# Altium schematic sheet Seven-Seg.SchDoc
size B; SheetNumber: 1; SheetTotal: 4
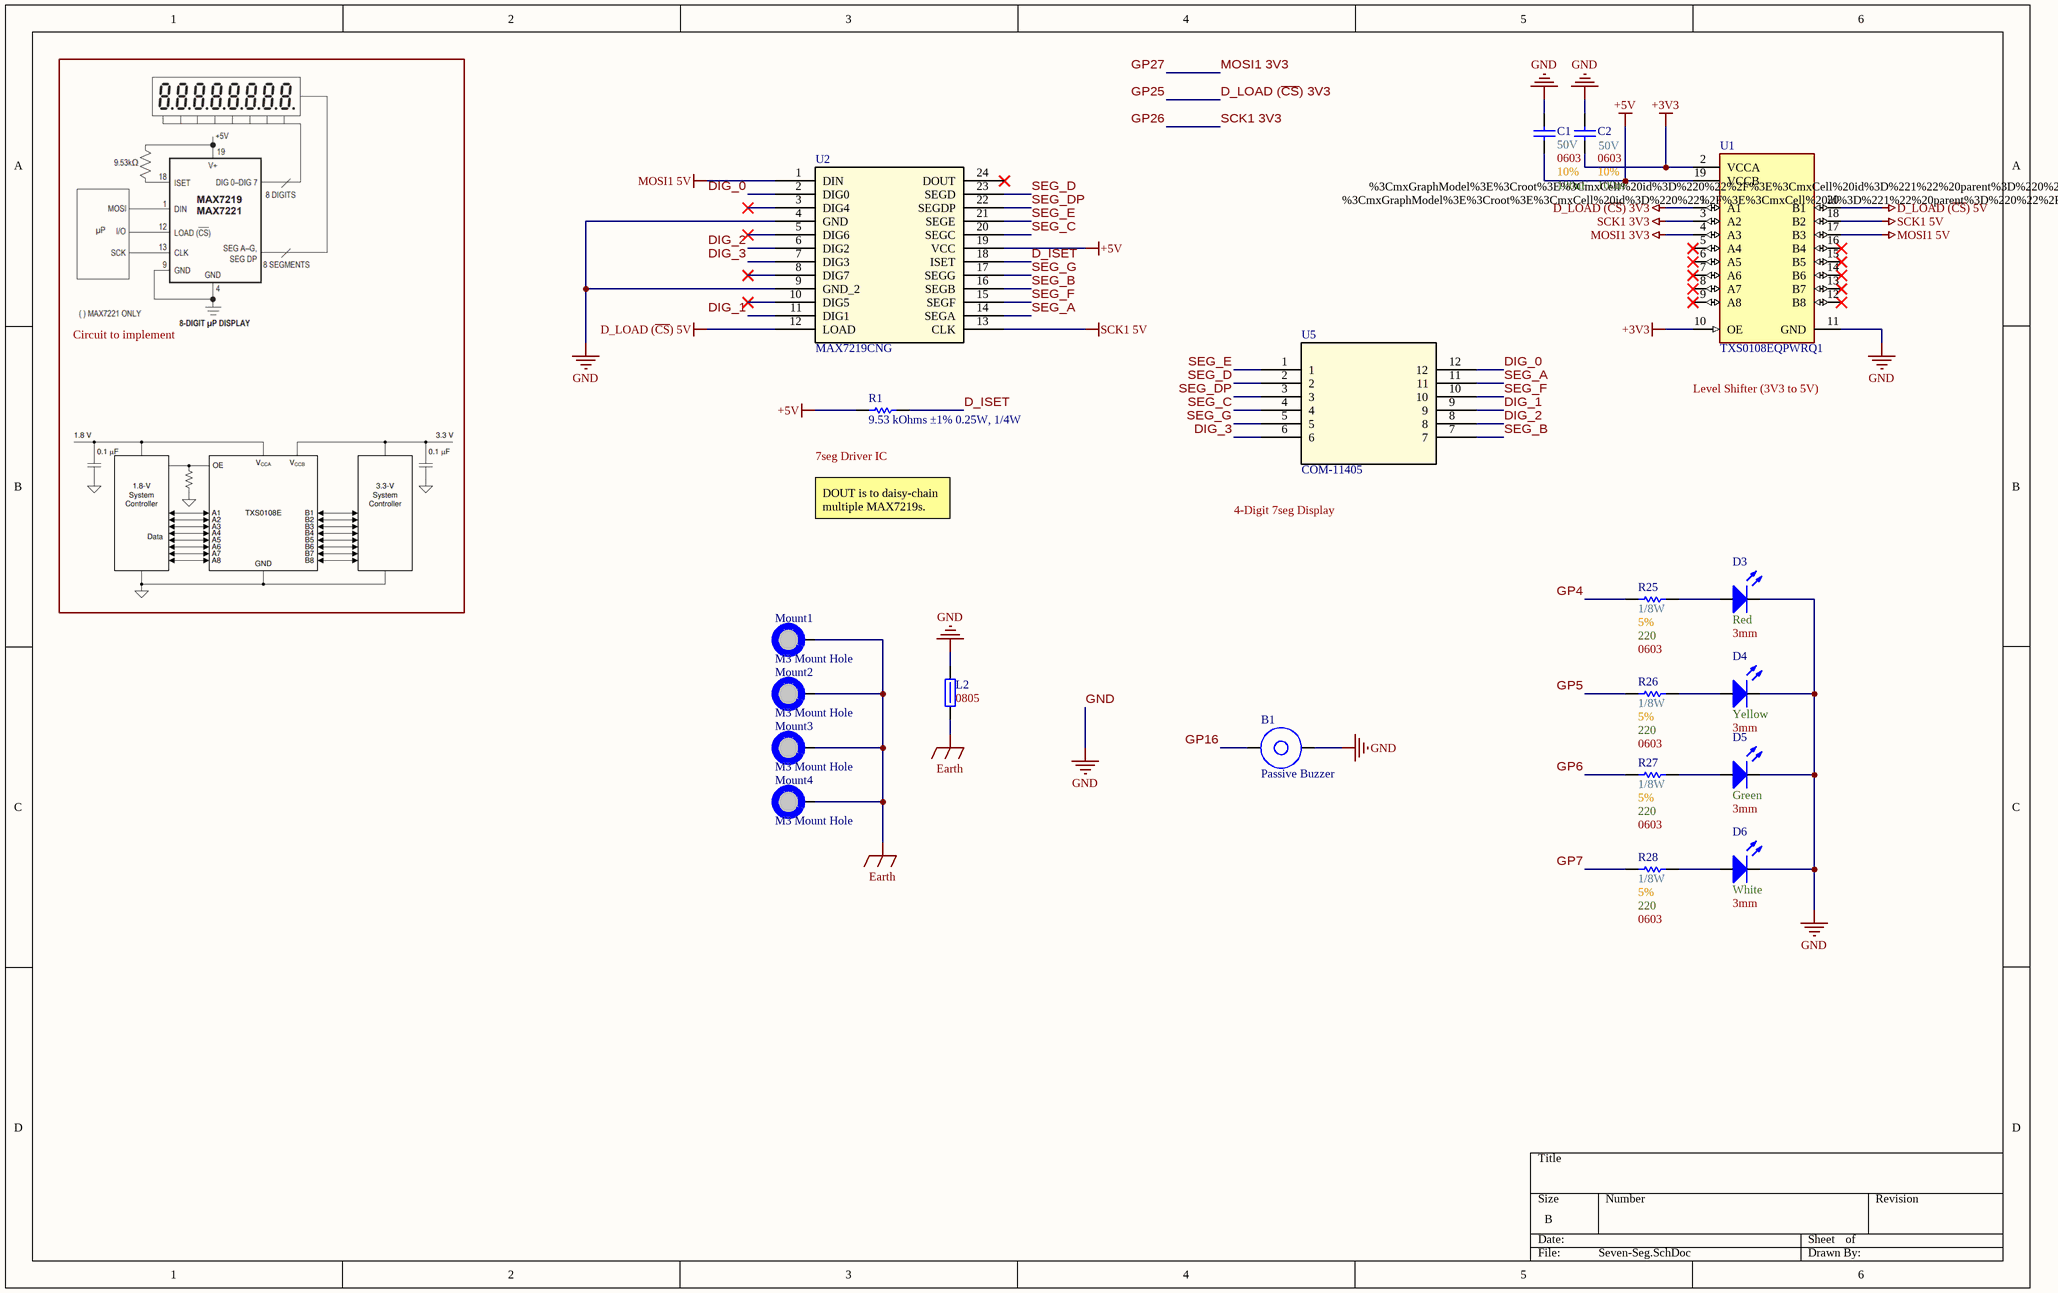
[diagram p0: Seven-Seg.SchDoc]

## Parts
B1  Passive Buzzer  [[Buzzer] Passive Thru-Hole 3V 30mA]
C1  Max Voltage: 50V  Size Package: 0603  Tolerance: 10%  Capacitance: 100nF  [[Cap] SMD 0603]  (hidden comment: [Cap] 0603 0.1uF 10% 50V)
C2  Max Voltage: 50V  Size Package: 0603  Tolerance: 10%  Capacitance: 100nF  [[Cap] SMD 0603]  (hidden comment: [Cap] 0603 0.1uF 10% 50V)
D3  Color: Red  Lens Diameter: 3mm  [[LED] Thru-Hole 3mm Red]  (hidden comment: [LED] Thru-Hole 3mm Red)
D4  Color: Yellow  Lens Diameter: 3mm  [[LED] Thru-Hole 3mm Yellow]  (hidden comment: [LED] Thru-Hole 3mm Yellow)
D5  Color: Green  Lens Diameter: 3mm  [[LED] Thru-Hole 3mm Green]  (hidden comment: [LED] Thru-Hole 3mm Green)
D6  Color: White  Lens Diameter: 3mm  [[LED] Thru-Hole 3mm White]  (hidden comment: [LED] Thru-Hole 3mm White)
L2  Size Package: 0805  [[Ferrite] SMD 0805]  (hidden comment: 652-MH2029-300Y)
Mount1  M3 Mount Hole  [[Mount] M3 Mount Hole]  (no BOM)
Mount2  M3 Mount Hole  [[Mount] M3 Mount Hole]  (no BOM)
Mount3  M3 Mount Hole  [[Mount] M3 Mount Hole]  (no BOM)
Mount4  M3 Mount Hole  [[Mount] M3 Mount Hole]  (no BOM)
R1  9.53 kOhms ±1% 0.25W, 1/4W  [RESC2013X60X30LL20T20]
R25  Wattage: 1/8W  Tolerance: 5%  Resistance: 220  Size Package: 0603  [[Res] SMD 0603]  (hidden comment: [220] SMD 0603 5% 1/10W)
R26  Wattage: 1/8W  Tolerance: 5%  Resistance: 220  Size Package: 0603  [[Res] SMD 0603]  (hidden comment: [220] SMD 0603 5% 1/10W)
R27  Wattage: 1/8W  Tolerance: 5%  Resistance: 220  Size Package: 0603  [[Res] SMD 0603]  (hidden comment: [220] SMD 0603 5% 1/10W)
R28  Wattage: 1/8W  Tolerance: 5%  Resistance: 220  Size Package: 0603  [[Res] SMD 0603]  (hidden comment: [220] SMD 0603 5% 1/10W)
U1  TXS0108EQPWRQ1  [FP-PW0020A-MFG]
U2  MAX7219CNG  [21-0043D_24_MXM]
U5  COM-11405  [COM-11405_SPK]

## Nets
+3V3: C2.1 U1.2(VCCA) U1.10(OE)
+5V: C1.1 R1.1 U1.19(VCCB) U2.19(VCC)
D_LOAD (~{CS}) 3V3: U1.1(A1)  [also labelled GP25]
D_LOAD (~{CS}) 5V: U1.20(B1) U2.12(LOAD)
Earth: L2.2 Mount1.1 Mount2.1 Mount3.1 Mount4.1
GND: B1.2(-) C1.2 C2.2 D3.2(Cathode) D4.2(Cathode) D5.2(Cathode) D6.2(Cathode) L2.1 U1.11(GND) U2.4(GND) U2.9(GND_2)
GP26: U1.3(A2)  [also labelled SCK1 3V3]
GP27: U1.4(A3)  [also labelled MOSI1 3V3]
MOSI1 5V: U1.17(B3) U2.1(DIN)
SCK1 5V: U1.18(B2) U2.13(CLK)
D_ISET: R1.2 U2.18(ISET)
DIG_0: U2.2(DIG0) U5.12
DIG_1: U2.11(DIG1) U5.9
DIG_2: U2.6(DIG2) U5.8
DIG_3: U2.7(DIG3) U5.6
GP4: R25.1
GP5: R26.1
GP6: R27.1
GP7: R28.1
GP16: B1.1(+)
SEG_A: U2.14(SEGA) U5.11
SEG_B: U2.16(SEGB) U5.7
SEG_C: U2.20(SEGC) U5.4
SEG_D: U2.23(SEGD) U5.2
SEG_DP: U2.22(SEGDP) U5.3
SEG_E: U2.21(SEGE) U5.1
SEG_F: U2.15(SEGF) U5.10
SEG_G: U2.17(SEGG) U5.5
NetD3_1: D3.1(Anode) R25.2
NetD4_1: D4.1(Anode) R26.2
NetD5_1: D5.1(Anode) R27.2
NetD6_1: D6.1(Anode) R28.2

Not connected (* = marked no-connect by the designer): U1 5(A4)* 6(A5)* 7(A6)* 8(A7)* 9(A8)* 12(B8)* 13(B7)* 14(B6)* 15(B5)* 16(B4)*; U2 3(DIG4)* 5(DIG6)* 8(DIG7)* 10(DIG5)* 24(DOUT)*

## Notes on the sheet
- %3CmxGraphModel%3E%3Croot%3E%3CmxCell%20id%3D%220%22%2F%3E%3CmxCell%20id%3D%221%22%20parent%3D%220%22%2F%3E%3CmxCell%20id%3D%222%22%20parent%3D%221%22%20style%3D%22shape%3Dimage%3BverticalLabelPosition%3Dbottom%3BlabelBackgroundColor%3Ddefault%3BverticalAlign%3Dtop%3Baspect%3Dfixed%3BimageAspect%3D0%3Bimage%3Ddata%3Aimage%2Fpng%2CiVBORw0KGgoAAAANSUhEUgAAAL4AAADECAYAAAAhzZs6AAAAAXNSR0IArs4c6QAAAARnQU1BAACxjwv8YQUAAAAJcEhZcwAAEnQAABJ0Ad5mH3gAABu5SURBVHhe7d17WFT1vsfxjzMKhEPAcGdUrnJRA4EIEy%2Bp%2B1jtNgTm8QiashMlE3aJJngShK2BYiFna7azsq25rUzzqVQ6bjUuSSpIQjvTyUE4KVchLiK3mfmePwaRWQmSghrr%2B3qeeXqe9Vuz1tB6z%2FSbH9oaQkSEQaSwsBCRkZEoLCwUDg0agYGBSEtLQ2BgoHCI9ZFEuIExMeDwmShx%2BEyUOHwmShw%2BEyUOn4lSn8LXNpSiIPsYvj5dggaNcFRHW%2F09ck5fwjWtcIQ9CNrrlDh1%2FCiOn1SiVn1zu%2FZaJVRKJZRKJZRKFcoqG9BtGGitQamqovuWTu1oamoTbuykxbVKVecxlVCVVaC%2Bvdvw9RpcUl1CzfVu2wBcr74EVWktWvU3DwzqlZrKPnuJ%2FGzs6ZFpM2mKpw1Z%2BkbT51c0gt1U9M4fLWmoTQR90aI%2FdK%2BdOXOGfHx8hJsHlYkTJ9I333wj3NyDJsrPCKXRchtyD5hEEzztSO4aQptPNxERUfO%2BMDIfZkK2Do7k6OhACrmMzN2epoTMclITUVvuK%2BQmC%2Bk6WltVIe1%2FI5qCvRXkvfIEtXU7003NtC%2FMnIaZ2JKDoyM5KCzJxNSBnnh5P5Woiagpl1aMk5F7zFFq7HyGpi6TokbLyOe1b6lZcLSB0Hv4LV%2FREgd7Ct15mTRERK1FlOxvQr5JRdTRtZOaSt8PIQfZQyTl8O%2BJ3xK%2BWpVOU008aNnROt011DTSqQR%2FMhufQPltuvAt7BfRwRvXTV1LJ5Ink7ldOH1aq9EPv%2BUgRbqMoseei6bwR03JY0Vv4VuQ%2FaKDpDushpqKM%2BgpG0t6bvdV0pCG6v%2B1jNxNvGl1XjMRNVHOinFkMjaWsnTvxwHX%2B1RHLcfkpSlYFWynmxMZusHLwxhNtb%2FgxoxH8%2FNHWLmhGn9eH44RUv2ns%2FtPU1WOKq0d3NxMdddQYgK%2FqFSkzB0HA%2BHOACCVY2L085jQWIC8c3qTHsBgGjafLcGpfRsR6jpMf6xXEsjGPo9Zvtdx%2FnsV1JDAdHoyNs1pxNsrMlDw7SYsf68N899Yg8ky4XMHRu%2Fhy%2FwxP24hJpjpdtNWH8L%2BHBNMD%2FKDIQBoK7Av7q%2F4v7AMvDxmqPDZ7AFg4BuOBT5FSAqaj3W7c6Cq10CqmIGlcXPgdcvygevnzqMUlrC1FnySSYwhk93Zp5v68mEcKTaG2xhHDAUAiQWeeX0TnrmShqeCNqN21iYkzzS%2FTZD9p%2B%2FnUSvxQVQs8qakYu0MGQAtqg%2BsRsKFWUhf5Y%2BHhPuzB4OhD%2BIyc7E9RIIjiUHwHOGMKYu3IK%2Fm5iqEtiYbW5bHICYmGi9GBCFw1g5II%2BKxwPXOItfRouqLVzHzial4zNUMRk4xuPjHLUgLt%2B6KTmLzNF74kwXq623xbMSTsOp7jXetb6fSViMzdg6S6pZgz7bZsJMA2pqDWB2Xg0dj5sLqihIXy67ievNVlKlKUXNPvpazvpLIxmB20m7kllRAeWgNxhUnIyhsKy50rdAZQW6vgEIxEq5%2BoVj7ZTHytwbBtm919GioxyzErUnA2qgpsBo%2BDuHLZ8O128Sg%2Fd9vIWlPKzw9GrEz6W38KJhZDSjhpP%2FXrlH%2Bhmk00msZHay8uZrT8sXL5PfII%2FRI52PsSDOSSMxopFcwvVl086vvvcZfbrtT05Uv19FLb35N9d0W4tpyl5Pb8CfpnWrNr7%2FcCghXdXSa6dO5ln3%2Fcqsppw9n2ZIifC9V3Xgd6gu05Q8WZPvcLipTvUt%2FsrakJ7ddJLX%2BgQbMbd7Taqh2RiDsPWusP5CBZ2xu7m4UlIGC4mIUdz7OvP9fGGkbgrdOfY5YL57vPxikMDWqwJGURKTnVurW57UNKM4qQLW1C1wevs3l7y8SO8xdEwWbQ68jI78VgAaXdsRiXZE%2FktLCMcr5z3jjNW%2FkJ6%2FArrIeflHUz3r%2FyduOYeOaAyj9%2BTD%2B4mcFc3Nz3cNuPvYKfvnAHkzDp2%2FAxykuyAzzgM1IFzgrHDBzlxli31%2BLaYbCvQfOUO8Y%2FHfQVbyTvBOq0j1YufYExsSnY5GzFIAU7i9uxirXLCSs2ovye%2FBL0CHEfxHld%2BfO%2FiJKK%2BrKylCttYSjkwWMhMMi0%2FsnPhtEjCB3cIcHRw9w%2BEysOHwmShw%2BEyUOn4kSh89EicNnosThM1Hi8JkocfhMlDh8JkocPhMlDp%2BJEofPRInDZ6LE4TNR4vCZKHH4TJQ4fCZKHD4TJQ6fiRKHz0SJw2eixOEzUeLwmShx%2BEyUOHwmShw%2BEyUOn4kSh89EicNnosThM1Hi8JkocfhMlDh8JkocPhMlDp%2BJEofPRInDZ6LE4TNR4vCZKHH4TJQ4fCZKHD4TJQ6fiRKHz0SJw2eiNOTAgQMk3Ph7plKp8NZbbyE9PV04NGjEx8dj4cKF8PT0FA6xPhry7LPPDqrw6%2BvrcfbsWTzxxBPCoUEjJycHY8eOhYWFhXCI9dEQIhpU4RcWFiIyMhKFhYXCoUEjMDAQaWlpCAwMFA6xPuI5PhMlDp%2BJEofPRInDZ6LE4TNR4vCZKHH4TJQ4fCZKfQpf21CKguxj%2BPp0CRo03QeuoVKlhFJ583GxvAHabruwB0N7nRKnjh%2FF8ZNK1Kpvbtdeq4Sq6%2FqpUFbZgG7DQGsNSlUV3bd0akdTU5tw46%2B0VZ1D3rHjyPmuDE2%2FCqMddcpTOH70OE4qa%2FXPO9CoV2oq%2B%2Bwl8rOxp0emzaQpnjZk6RtNn1%2FR6IabPqQQmQE9ZGpGZma6h%2FXsnfSL8DD30JkzZ8jHx0e4eVCZOHEiffPNN8LNPWii%2FIxQGi23IfeASTTB047kriG0%2BXQTERE17wsj82EmZOvgSI6ODqSQy8jc7WlKyCwnNRG15b5CbrKQrqO1VRXS%2FjeiKdhbQd4rT1BbtzPp0VTQV2um00hzBT3y%2BETydZKTpc8S%2BkSl1o035VNG6GiS27hTwKQJ5GknJ9eQzdT5sgZc7%2BG3fEVLHOwpdOdl0hARtRZRsr8J%2BSYVUQcRqX%2FaSIEWs%2Bmja8In3j8cvj61Kp2mmnjQsqN1umuoaaRTCf5kNj6B8tt04VvYL6KDLTeeUEsnkieTuV04fVqr0Q%2B%2F5SBFuoyix56LpvBHTcljRU%2Fha6j8w%2BfIThFMb%2F%2FQeeCOMto9ZwRZBX9AVzRqUqVPJROPZXS0Tvchqmk8RQn%2BZjQ%2BIV%2F%2FUAOk96mOWo7JS1OwKthONycydIOXhzGaan%2BBBoCmogJXLexhN1T4RPag0FSVo0prBzc3U901lJjALyoVKXPHwUC4MwBI5ZgY%2FTwmNBYg75xg8mEwDZvPluDUvo0IdR2mP9ad9go%2B%2B8cRWEUk4oUxRrptQ0fhP1fG4g%2BG1Sjt0KCqvApaOze4meoSlJj4ISo1BXPHGUBzaReiglbhb1tfxAwvFziPfQJL%2FvEDWvXPcld6D1%2Fmj%2FlxCzHBTLebtvoQ9ueYYHqQHwwBqCsrUV2bieVedjC3csKjczYgq%2FpXEzl2Hxn4hmOBTxGSguZj3e4cqOo1kCpmYGncHHjdsnzg%2BrnzKIUlbK2l%2BgMSY8hkgm230vETzpUMhYeXp96by8B%2FOfbsXYWJhgbwDV8An6IkBM1fh905KtRrpFDMWIq4OV6g5lKc%2Bd%2B38N5Zf6z9%2BDA%2BjDTBoRVr8dkv%2FddW7%2BF3p1big6hY5E1JxdoZMt02p%2BlYMD8SSXvzUHD4dQRcTMX8V79AP74%2BdrcMfRCXmYvtIRIcSQyC5whnTFm8BXk1Ny%2BStiYbW5bHICYmGi9GBCFw1g5II%2BKxwLUPkd8KtaKt3QCGhj3nZegTh8zc7QiRHEFikCdGOE%2FB4i156HpZhlMRk7YIU8a4I%2FCFWfBtL8VPl%2FsvrJ5fWXfaamTGzkFS3RLs2TYbdp3PMn50MTIyViHY2wku%2FuHYuCYY2uxMFHQID8DuJ4lsDGYn7UZuSQWUh9ZgXHEygsK24kLXCp0R5PYKKBQj4eoXirVfFiN%2FaxBs%2B1bHrw0xhrFRG643d18CFJJANmY2knbnoqRCiUNrxqE4OQhhWy90jkshvfG%2BGyqFFFpo%2B6%2F7voTfjIJNcxGVPQl%2F37saAZ0f9kA7Lhx%2BHwfO3ly%2BHGZqAqOOdrQOqj%2Fh%2F3umQfnB9ViWnoUGLQAYw3HqYmS8uQCWJw8ju0535SRWAZj3ajzi4%2BOwMuYFhASMROfM%2FM4M84SXO%2FDvM9%2Bhvdvm1uOrMXnSanx9vRwH1y9DelZnO8aOmLo4A28usMTJw9ndnjFwbhO%2BGqqdEQh7zxrrD2TgGRv93Rvz%2FoYXX%2F0A59sAaGtw7JNjaPB%2BHL49zB3ZvSaFqVEFjqQkIj23UrdOrm1AcVYBqq1d4PLwbS7%2FnZJYIXRxMFp3JyI9vx5aANqmImzbsANlLgEYb2QKo4ojSElMR26l7gu0tqEYWQXVsHZxER5tQPT%2Bk7cdw8Y1B1D682H8xc8K5ubmuofdfOy9bgC%2FFVvx8tD%2FwVQnN3g6e%2BD5XD%2BkbloARe9HZffQ8Okb8HGKCzLDPGAz0gXOCgfM3GWG2PfXYpqhcO%2F%2BIoFF8P%2Fg43g5PnzKCSOcXaEY9QS2Gy%2FHP9ODYS4ZjukbPkaKSybCPGww0sUZCoeZ2GUWi%2FfXThMebGAI1zd%2FOw01V5XQhYtV9CAs5%2FM6fk9aqLb0PP1YcpVuLNnfEy3VVPLjOSqp7uGsLbVUev5HKrnaw%2FgA6YfPZgmMrZ3g5mKN4cIh9gAxgtzBHR5OFnc3f%2F%2BtjKzg5OEJJ6sezmokh4O7B5wsehgfIP0QPmO%2FPxw%2BEyUOn4kSh89EicNnosThM1Hi8JkocfhMlDh8JkocPhMlDp%2BJEofPRInDZ6LE4TNR4vCZKHH4TJQ4fCZKHD4TJQ6fiRKHz0SJw2eixOEzUeLwmShx%2BEyUOHwmShw%2BEyUOn4nSEKlUOqj%2Bb%2FZEBK1WC2nXXQUGH41GA4lEgiFDhgiHWB8N6ejoGFThFxYWIioqCvn5%2BcKhQWPKlClITU1FYGCgcIj10RAiGnThR0ZGorCwUDg0aAQGBiItLY3Dvws8x2eixOEzUeLwmShx%2BEyUOHwmShw%2BEyUOn4lSn8LXNpSiIPsYvj5dgoYe7tKubqrElZrmrrucswdLe50Sp44fxfGTStTq7qkMANBeq4RKqYRSqYRSqUJZZYPuRtA3tNagVFXRfUundjQ1tQk36muvg%2FLUcRw9fhLK7ift0oaqc3k4djwH35U13WxHew2VqhJUNXevqQ11ZRehqrzWP40J7%2F%2BpT01ln71Efjb29Mi0mTTF04YsfaPp8yuarj2ainfSsmnOZCaTk%2FerX1Or3vPvPb7PrVAT5WeE0mi5DbkHTKIJnnYkdw2hzaebiIioeV8YmQ8zIVsHR3J0dCCFXEbmbk9TQmY5qYmoLfcVcpOFdB2traqQ9r8RTcHeCvJeeYLaup2pu6b8DAodLScb9wCaNMGT7OSuFLL5NOnOSqSp%2BIrWTB9J5opH6PGJvuQktySfJZ%2BQSk1EzfsozMKeFh28ce%2FbDir5MIycLCdQYu4vdLO%2BO9d7%2BC1f0RIHewrdeVl3stYiSvY3Id%2BkIuogIk31fopwtKepr31JF5v64%2BXcPQ5fn1qVTlNNPGjZ0TrdNdQ00qkEfzIbn0D5bbrwLewXUVdj6lo6kTyZzO3C6dNajX74LQcp0mUUPfZcNIU%2FakoeK3oIX62i9Kkm5LHsKNXpTkqNpxLI32w8JeS3EWnK6cPn7EgR%2FDb90HnejrLdNGeEFQV%2FcIU0euFrqPrIKzRe7kaLPrtMasGp7lTvUx21HJOXpmBVsJ1uTmToBi8PYzTV%2FgINNFDueBOZHonYlfwnuMh6PxS7PzRV5ajS2sHNzVR3DSUm8ItKRcrccTAQ7gwAUjkmRj%2BPCY0FyDsnmJ4YTMPmsyU4tW8jQl2H6Y91p6lCeZUWdm5uMNWdFCZ%2BUUhNmYtxBoD2ymf4xxErRCS%2BgDGd93UeOuo%2FsTL2DzCsLkVHt0M1f%2Fcm5j7%2FCeyS92NrqAL99UcPe69V5o%2F5cQsxwUy3m7b6EPbnmGB6kB8MtXX4Jvt7yKV5WOzjAGsbZzy%2BcBsKmvplBsb6iYFvOBb4FCEpaD7W7c6Bql4DqWIGlsbNgdctyweunzuPUljC1lqQmcQYMlkf0jPwRfgCHxQlBWH%2But3IUdVDI1VgxtI4zPEyQMdP51Ay1ANent1fgAH8l%2B%2FB3lUTYdi5RXN5DxbNSkZN%2BD%2Fxz5fG9esd2XsPvzu1Eh9ExSJvSirWzpAB2nL8XNmKyxUmWLjzW1w4vRUTf3gNC9edxG2%2B8rB7ydAHcZm52B4iwZHEIHiOcMaUxVuQV3PzA0pbk40ty2MQExONFyOCEDhrB6QR8Vjg2ofIb8kQPnGZyN0eAsmRRAR5joDzlMXYklcDLQBqbUO7gSEMe6tPW4mPXl6GvWXtaGlsRLtw%2FC71duqbtNXIjJ2DpLol2LNtNuwkALRtaGs3wBMxqQj3sYe5w1OIj3ocl4%2F9L87f6gs8u28ksjGYnbQbuSUVUB5ag3HFyQgK24oLXSt0RpDbK6BQjISrXyjWflmM%2FK1BsO1bHbcmkWHM7CTszi1BhfIQ1owrRnJQGLZe0GCIsTGM2q6juYcVQh0JbJ99Fz%2BcScGIA8uwdOcl9Lr7b9SHH60ZBZvmIip7Ev6%2BdzUCZJ2bpTawtZTgWkN95%2FKSBA8NfwgStRodPNt5QGhQfnA9lqVnoUELAMZwnLoYGW8ugOXJw8iu67xyVgGY92o84uPjsDLmBYQEjLyraYWm%2FCDWL0tHlu6kMHacisUZb2KB5Ukczq7DME8vuOPfOPNd98%2FxVhxfPRmTVn%2BtmzFILPDEvNnw9FmO9994FKdXvoD04v6bS9wmfDVUOyMQ9p411h%2FIwDM23XaXjsDTQb74%2Fh8ZyK7RAu0l%2BHjvSZgFTIbe1I3dR1KYGlXgSEoi0nMrdevz2gYUZxWg2toFLg%2Ff5vLfIampESqOpCAxPReVupOioTgLBdXWcHF5GBKrUCwObsXuxHTk12sBaNFUtA0bdpTBJWA8dF%2BbpRgq1f3TeeE72Bp6Ga8vSEBO55vprgmXefS0fkWLR0hpqKEJmZqZkdmNh%2B08%2BqSZiFq%2Bp3fDPMnCwoFGK%2BRkH7iKDlXc32VNXs4U0DRSwTsR5G9nSvIRzuRka0rmo4Por8erSNO5jq%2B3nCkgXMfXaaZP51r2vJxJGmoseIci%2FO3IVD6CnJ1sydR8NAX99ThVdeah%2BeVbSn9uDMnN7MjJxZbMzNzp2dQcuqp7UYJ1fCJNfRa96mVKrosOUH8k1nv4faKmpvKf6Pylq%2Ff9l1fE4feihWpLz9OPJVeph8YHREttKZ3%2FsYSu9nDSluoS%2BvFcCVX3MD5Q%2BuG%2FdVLI7Fzh7mjRtQzFHkRGkDu4w8PJ4q7m77%2BVkdwB7h5OsOjhpEZWTvDwdIJVD%2BMDpR%2FCZ%2Bz3h8NnosThM1Hi8JkocfhMlDh8JkocPhMlDp%2BJEofPRInDZ6LE4TNR4vCZKHH4TJQ4fCZKHD4TJQ6fiRKHz0SJw2eixOEzUeLwmShx%2BEyUOHwmShw%2BEyUOn4kSh89EicNnosThM1EaMnfuXBJu%2FD2rq6vD6dOn8dRTTwmHBo2jR4%2FC29sbVlZWwiHWR0M%2B%2BuijQRX%2BpUuXsH37dqSmpgqHBo3ExETMmzcP7u7uwiHWR0OIaFCFX1hYiMjISBQWFgqHBo3AwECkpaUhMDBQOMT6iOf4TJQ4fCZKHD4TJQ6fiRKHz0SJw2eixOEzUepT%2BNqGUhRkH8PXp0vQcOO%2B6q01KL2ohFIpeJRUobmf7sHL%2Bk97nRKnjh%2FF8ZNK1Kpvbtdeq4Sq6%2FqpUFbZoLsR9A2tNShVVXTf0qkdTU23utO4Fg3lFzuP9wNOZ%2F0LOWd%2B7Dp%2B5bVrqLmkwqWa6%2FpPu16NS6pS1Lbqbx4wwvt%2F6lNT2WcvkZ%2BNPT0ybSZN8bQhS99o%2BvyKhjrOptEfx3qQh8eNhzu52T9MQ0e%2FQjn38Ya3fJ9boSbKzwil0XIbcg%2BYRBM87UjuGkKbTzcRdd7g2XyYCdk6OJKjowMp5DIyd3uaEjLLSX2LGzy3VRXS%2FjeiKdhbQd4rb3WD53r65M9u5OjoSI4OVjR8CEgisyYHR0dydPKhV76qodwV40jmHkNHGzufoqmjzKjRJPN5jb5tFhxugPQefstXtMTBnkJ3XiYNEVFrESX7m5BvUhF1CPfV1NH%2B50fR%2BDX5t%2FiXce9w%2BPrUqnSaauJBy47W6a6hppFOJfiT2fgEym%2B7xZ3N1bV0InkymduF06e1Gv3wWw5SpMsoeuy5aAp%2F1LSXO5t36iimJL%2FhNHOb7i7qN2jq%2F0XL3E3Ie3UeNRNRU84KGmcylmKzdG%2FGe6H3qY5ajslLU7Aq2E43JzJ0g5eHMZpqf8GNGc8Nmku7sPWYJ5ZE%2BsBAMMbuH01VOaq0dnBzM9VdQ4kJ%2FKJSkTJ33K2vk1SOidHPY0JjAfLO6U16AINp2Hy2BKf2bUSo6zD9sd9AYjodyZvmoPHtFcgo%2BBablr%2BHtvlvYM1kmXDXAdN7%2BDJ%2FzI9biAlmut201YewP8cE04P8BHcxb8O3b7%2BDS%2F%2BxFGEOUr0Rdn8Z%2BIZjgU8RkoLmY93uHKjqNZAqZmBp3Bx43bJ84Pq58yiFJWytBddSYgyZrD%2BurwQWz7yOTc9cQdpTQdhcOwubkmfCvPca%2B1XfT6VW4oOoWORNScXaGfrvTG3NfvztIwOEvfQ0zPRG2H1n6IO4zFxsD5HgSGIQPEc4Y8riLcirubkCoa3JxpblMYiJicaLEUEInLUD0oh4LHDtj8h7ILHB0y%2F8CRb19bB9NgJPWvU9xf7Qt7Npq5EZOwdJdUuwZ9ts2Ok9S40L77%2BFrLGRWOLXw0cIu68ksjGYnbQbuSUVUB5ag3HFyQgK24oLXfNVI8jtFVAoRsLVLxRrvyxG%2FtYg2PatjjvT%2Fm%2B8lbQHrZ4eaNyZhLd%2FFEyrBlgffrRmFGyai6jsSfj73tUIEE7DmrOxdUcZnnxxHkYN4AcEuxMalB9cj2XpWWjQAoAxHKcuRsabC2B58jCy63Sf%2BhKrAMx7NR7x8XFYGfMCQgJGwkh4qH6lgXL7cmz8aQY2HPoC6yf9gJTl70Il%2FOI4gG4TvhqqnREIe88a6w9k4Bkb4e5alH%2FyN%2BwzmIdlz5jf7mDsnpPC1KgCR1ISkZ5bqVuf1zagOKsA1dYucHn4%2FlwxzaUdiF1XBP%2BkNISPcsaf33gN3vnJWLGr7FeLJgOl95%2B87Rg2rjmA0p8P4y9%2BVjA3N9c97OZj73UA6u%2Fx7rYTGLskCv7633bZA2L49A34OMUFmWEesBnpAmeFA2buMkPs%2B2sx7X5cM83P2LNyLU6MiUf6ImdIAUjdX8TmVa7ISliFveX35ref%2FDewfofu7G9gtaKurAzVWks4OlkM8FTmwdf7Jz4bRIwgd3CHB0cPcPhMrDh8JkocPhMlDp%2BJEofPRInDZ6LE4TNR4vCZKHH4TJQ4fCZK%2Fw%2BAfBs0mVwulgAAAABJRU5ErkJggg%3D%3D%3B%22%20value%3D%22%22%20vertex%3D%221%22%3E%3CmxGeometry%20height%3D%2280%22%20width%3D%2277.55%22%20x%3D%22200.61%22%20y%3D%22280%22%20as%3D%22geometry%22%2F%3E%3C%2FmxCell%3E%3C%2Froot%3E%3C%2FmxGraphModel%3E
- Circuit to implement
- Level Shifter (3V3 to 5V)
- (near R1) 7seg Driver IC
- DOUT is to daisy-chain multiple MAX7219s.
- 4-Digit 7seg Display

## Library data of the parts
B1 = [Buzzer] Passive Thru-Hole 3V 30mA: AI-1223-TWT-3V-2-R; Supplier 1: DigiKey; Supplier Part Number 1: 668-1456-ND
C1 C2 = [Cap] 0603 0.1uF 10% 50V: GCM155R71H104KE02J; Supplier 1: DigiKey; Supplier Part Number 1: 490-14514-6-ND
D3 = [LED] Thru-Hole 3mm Red: 151031SS06000; Supplier 1: DigiKey; Supplier Part Number 1: 732-5006-ND
D4 = [LED] Thru-Hole 3mm Yellow: 151031YS05900; Supplier 1: DigiKey; Supplier Part Number 1: 732-5009-ND
D5 = [LED] Thru-Hole 3mm Green: 151031VS06000; Supplier 1: DigiKey; Supplier Part Number 1: 732-5008-ND
D6 = [LED] Thru-Hole 3mm White: 151031VS06000; Supplier 1: DigiKey; Supplier Part Number 1: 1516-QBL7IW60D-WW-ND
L2 = [Ferrite] SMD 0805 3A 30ohm: Res @ Freq: 30 @ 100MHz; Supplier 1: DigiKey; Supplier Part Number 1: MH2029-300YCT-ND
Mount1-Mount4 = [Mount] M3 Mount Hole: Place at least 4.5mm from board edge. Plated.
R1 = CMP-2001-01986-1: RK73H2ATTD9531F; Manufacturer: KOA Speer; Part Number: RK73H2ATTD9531F
R25-R28 = [220] SMD 0603 5% 1/10W: RK73B1JTTD221J; Supplier 1: DigiKey; Supplier Part Number 1: 2019-RK73B1JTTD221JDKR-ND
U1 = CMP-04899-000001-1: IC TRNSLTR BIDIRECTIONAL 20TSSOP; Manufacturer: Texas Instruments; Standoff Height: 0.05mm; Number Of Circuits: 1; V A Max: 3.6V; Automotive Grade: Grade 1; Number Of Inputs: 8; Max Junction Temp: +150°C; V A Min: 1.4V; Nominal Supply Current: 8uA; Logic Function Desc: Non-inverting; V B Max: 5.5V; V B Min: 1.65V; Data Rate: 110Mbits/s; Ambient Temperature Range High: +125°C; Height: 1.2mm; Temperature Range High: +125°C; ComponentLink2Description: Datasheet; Manufacturer Part Number: TXS0108EQPWRQ1; Digikey Description: IC TRNSLTR BIDIRECTIONAL 20TSSOP; Lead Free: Yes; Automotive: Yes; Number Of Outputs: 8; Temperature Range Low: -40°C; Mouser Description: Translation - Voltage Levels 8B Bidir Vltg-Level Translator ALT 595-TXS0108EPWR; Ambient Temperature Range Low: -40°C; ComponentLink2URL: http://www.ti.com/lit/ds/symlink/txs0108e-q1.pdf; Device Class L2: Logic ICs; Min Supply Voltage: 1.4V; Device Class L1: Integrated Circuits (ICs); Octopart: https://octopart.com/txs0108eqpwrq1-texas+instruments-59160487; Temperature: -40°C to +125°C; Package: PW0020A; RoHS: TRUE; Ipc Land Pattern Name: SOP65P640X120-20; Device Class L3: Voltage Level Shifters; Max Supply Voltage: 5.5V; Category: IC
U2 = MAX7219CNG: No Description Available; Manufacturer_Name: Analog Devices Inc; Copyright: Copyright (C) 2026 Ultra Librarian. All rights reserved.; Manufacturer_Part_Number: MAX7219CNG; RefDes: RefDes; Type: Type
U5 = COM-11405: Description; Manufacturer_Name: Sparkfun; Copyright: Copyright (C) 2026 Ultra Librarian. All rights reserved.; Manufacturer_Part_Number: COM-11405; RefDes: RefDes; Type: Type